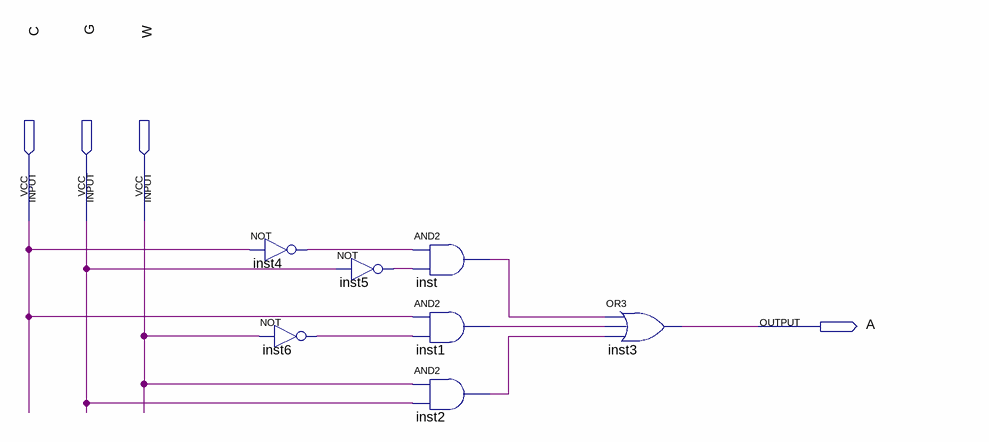
[diagram p0: schematic sheet]
// Quartus schematic lab3step0.bdf as structural Verilog: 7 symbols, 4 pins
module lab3step0 (
  input  C,
  input  G,
  input  W,
  output A
);

  wire inst1_out, inst2_out, inst4_out, inst5_out, inst6_out, inst_out;

  not inst4 (inst4_out, C);
  not inst6 (inst6_out, W);
  not inst5 (inst5_out, G);
  and inst (inst_out, inst4_out, inst5_out);
  and inst1 (inst1_out, C, inst6_out);
  and inst2 (inst2_out, W, G);
  or inst3 (A, inst_out, inst1_out, inst2_out);
endmodule
